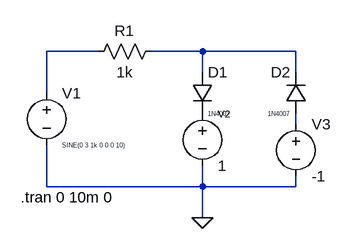
[diagram p0: schematic biased.asc]
biased.asc, the LTspice schematic file:
Version 4.1
SHEET 1 880 680
WIRE 144 32 64 32
WIRE 304 32 224 32
WIRE 448 32 304 32
WIRE 304 64 304 32
WIRE 448 64 448 32
WIRE 64 96 64 32
WIRE 448 144 448 128
WIRE 64 240 64 176
WIRE 304 240 304 208
WIRE 304 240 64 240
WIRE 448 240 448 224
WIRE 448 240 304 240
WIRE 304 288 304 240
FLAG 304 288 0
SYMBOL voltage 64 80 R0
WINDOW 3 24 96 Left 0
WINDOW 123 0 0 Left 0
WINDOW 39 0 0 Left 0
SYMATTR InstName V1
SYMATTR Value SINE(0 3 1k 0 0 0 10)
SYMBOL res 240 16 R90
WINDOW 0 0 56 VBottom 2
WINDOW 3 32 56 VTop 2
SYMATTR InstName R1
SYMATTR Value 1k
SYMBOL diode 288 64 R0
WINDOW 3 24 64 Left 0
SYMATTR InstName D1
SYMATTR Value 1N4007
SYMBOL diode 464 128 R180
WINDOW 0 24 64 Left 2
WINDOW 3 24 0 Left 0
SYMATTR InstName D2
SYMATTR Value 1N4007
SYMBOL voltage 304 112 R0
WINDOW 0 24 16 Left 1
WINDOW 123 0 0 Left 0
WINDOW 39 0 0 Left 0
SYMATTR InstName V2
SYMATTR Value 1
SYMBOL voltage 448 128 R0
WINDOW 123 0 0 Left 0
WINDOW 39 0 0 Left 0
SYMATTR InstName V3
SYMATTR Value -1
TEXT 24 256 Left 2 !.tran 0 10m 0

The netlist it stands for:
* biased.asc
V1 N001 0 SINE(0 3 1k 0 0 0 10)
R1 N002 N001 1k
D1 N002 P001 1N4007
D2 N003 N002 1N4007
V2 P001 0 1
V3 N003 0 -1
.model D D
.lib standard.dio
.tran 0 10m 0
.backanno
.end